# Altium schematic sheet 03_ADC_Reference.SchDoc
size A; SheetNumber: 2; SheetTotal: 6
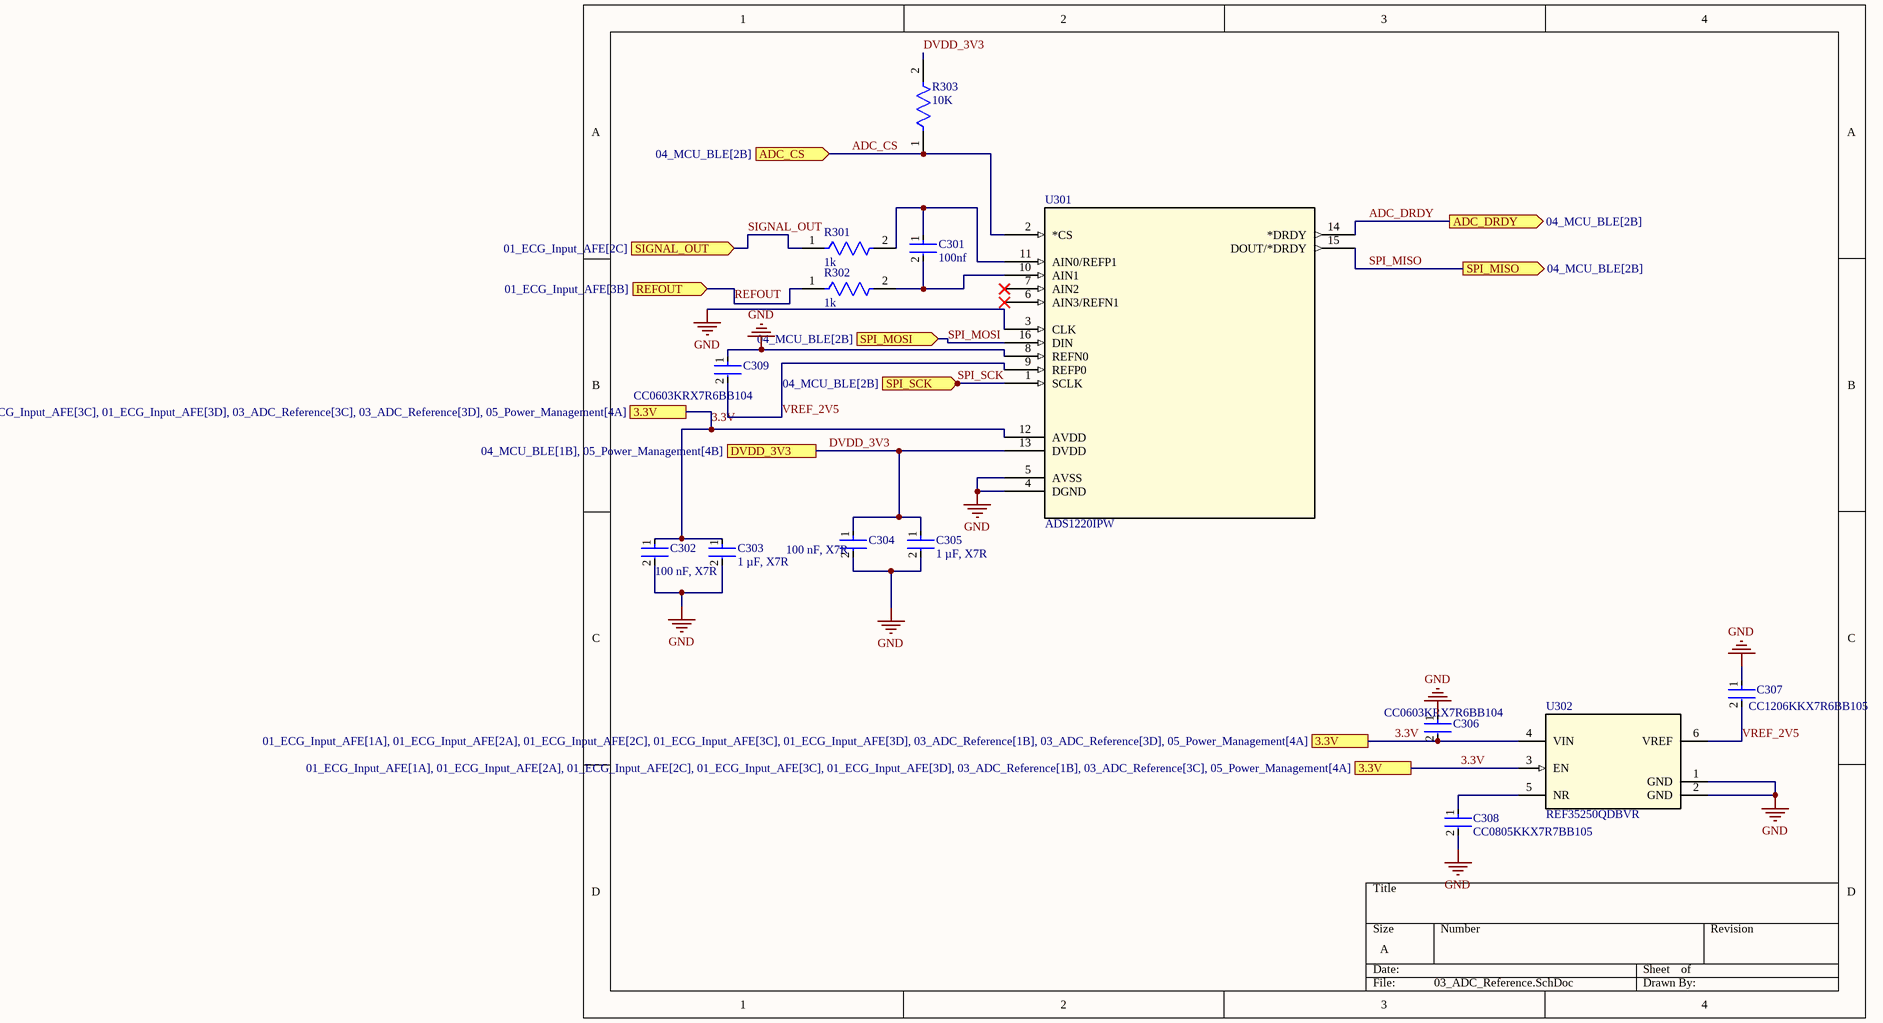
[diagram p0: 03_ADC_Reference.SchDoc]

## Parts
C301  100nf  [FP-CC0603-DA-MFG]
C302  100 nF, X7R  [FP-CC0603-DA-MFG]
C303  1 µF, X7R  [FP-CC0805-0_85-MFG]
C304  100 nF, X7R  [FP-CC0603-DA-MFG]
C305  1 µF, X7R  [FP-CC0805-0_85-MFG]
C306  CC0603KRX7R6BB104  [FP-CC0603-DA-MFG]
C307  CC1206KKX7R6BB105  [FP-CC1206-1_25-MFG]
C308  CC0805KKX7R7BB105  [FP-CC0805-0_85-MFG]
C309  CC0603KRX7R6BB104  [FP-CC0603-DA-MFG]
R301  1k  [FP-AC0603-IPC_B]
R302  1k  [FP-AC0603-IPC_B]
R303  10K  [FP-MCT0603-IPC_B]
U301  ADS1220IPW  [PW16]
U302  REF35250QDBVR  [DBV0006A-IPC_A]

## Ports
3.3V (see 01_ECG_Input_AFE[1A], 01_ECG_Input_AFE[2A], 01_ECG_Input_AFE[2C], 01_ECG_Input_AFE[3C], 01_ECG_Input_AFE[3D], 03_ADC_Reference[1B], 03_ADC_Reference[3C], 05_Power_Management[4A]), 3.3V (see 01_ECG_Input_AFE[1A], 01_ECG_Input_AFE[2A], 01_ECG_Input_AFE[2C], 01_ECG_Input_AFE[3C], 01_ECG_Input_AFE[3D], 03_ADC_Reference[1B], 03_ADC_Reference[3D], 05_Power_Management[4A]), 3.3V (see 01_ECG_Input_AFE[1A], 01_ECG_Input_AFE[2A], 01_ECG_Input_AFE[2C], 01_ECG_Input_AFE[3C], 01_ECG_Input_AFE[3D], 03_ADC_Reference[3C], 03_ADC_Reference[3D], 05_Power_Management[4A]), ADC_CS (in, see 04_MCU_BLE[2B]), ADC_DRDY (out, see 04_MCU_BLE[2B]), DVDD_3V3 (see 04_MCU_BLE[1B], 05_Power_Management[4B]), REFOUT (in, see 01_ECG_Input_AFE[3B]), SIGNAL_OUT (in, see 01_ECG_Input_AFE[2C]), SPI_MISO (out, see 04_MCU_BLE[2B]), SPI_MOSI (in, see 04_MCU_BLE[2B]), SPI_SCK (in, see 04_MCU_BLE[2B])

## Nets
GND: C302.2 C303.2 C304.2 C305.2 C306.1 C307.1 C308.2 C309.1 U301.3(CLK) U301.4(DGND) U301.5(AVSS) U301.8(REFN0) U302.1(GND) U302.2(GND)
3.3V: C302.1 C303.1 C306.2 U301.12(AVDD) U302.3(EN) U302.4(VIN) ; port 3.3V
ADC_CS: R303.1 U301.2(*CS) ; port ADC_CS
ADC_DRDY: U301.14(*DRDY) ; port ADC_DRDY
DVDD_3V3: C304.1 C305.1 R303.2 U301.13(DVDD) ; port DVDD_3V3
REFOUT: R302.1 ; port REFOUT
SIGNAL_OUT: R301.1 ; port SIGNAL_OUT
SPI_MISO: U301.15(DOUT/*DRDY) ; port SPI_MISO
SPI_MOSI: U301.16(DIN) ; port SPI_MOSI
SPI_SCK: U301.1(SCLK) ; port SPI_SCK
VREF_2V5: C307.2 C309.2 U301.9(REFP0) U302.6(VREF)
NetC301_1: C301.1 R301.2 U301.11(AIN0/REFP1)
NetC301_2: C301.2 R302.2 U301.10(AIN1)
NetC308_1: C308.1 U302.5(NR)

Not connected (* = marked no-connect by the designer): U301 6(AIN3/REFN1)* 7(AIN2)*

## Library data of the parts
C301 = CMP-03422-001228-1: CAP CER 0.1UF 10V X7R 0603, CC0603KRX7R6BB104; Manufacturer: YAGEO; Material: Ceramic; Tolerance: 0.1; Temperature Coefficient: 15%; Height: 0.9mm; RoHS: TRUE; Footprint Url: http://www.yageo.com/exep/pages/download/literatures/UPY-C_GEN_24.pdf; Octopart: https://octopart.com/cc0603krx7r6bb104-yageo-9291607; Device Class L1: Passive Components; Mouser Description: 0603 0.1 uF 10 V ±10 % Tolerance X7R SMT Multilayer Ceramic Capacitor; ComponentLink2URL: http://www.yageo.com/documents/recent/UPY-GPHC_X7R_6.3V-to-50V_18.pdf; Automotive: No; Voltage: 10 V; Capacitance: 100 nF; Device Class L3: Ceramic Capacitors; Category: Cap; Manufacturer Part Number: CC0603KRX7R6BB104; Temperature: -55°C to +125°C; ComponentLink2Description: Datasheet; Voltage Rating: 10 V; Device Class L2: Capacitors; Lead Free: Yes; Temperature Range High: +125°C; Temperature Range Low: -55°C; Digikey Description: CAP CER 0.1UF 10V X7R 0603; Package: CC0603-DA; Temperature Characteristic: X7R; Value: 100 nF
C302 = CMP-03422-001228-1: CAP CER 0.1UF 10V X7R 0603    CC0603KRX7R6BB104; Manufacturer: YAGEO; Material: Ceramic; Tolerance: 0.1; Capacitance: 100 nF; Temperature Coefficient: 15%; Value: 100 nF; Height: 0.9mm; RoHS: TRUE; Footprint Url: http://www.yageo.com/exep/pages/download/literatures/UPY-C_GEN_24.pdf; Octopart: https://octopart.com/cc0603krx7r6bb104-yageo-9291607; Device Class L1: Passive Components; Mouser Description: 0603 0.1 uF 10 V ±10 % Tolerance X7R SMT Multilayer Ceramic Capacitor; ComponentLink2URL: http://www.yageo.com/documents/recent/UPY-GPHC_X7R_6.3V-to-50V_18.pdf; Automotive: No; Voltage: 10 V; Device Class L3: Ceramic Capacitors; Category: Cap; Manufacturer Part Number: CC0603KRX7R6BB104; Temperature: -55°C to +125°C; ComponentLink2Description: Datasheet; Voltage Rating: 10 V; Device Class L2: Capacitors; Lead Free: Yes; Temperature Range High: +125°C; Temperature Range Low: -55°C; Digikey Description: CAP CER 0.1UF 10V X7R 0603; Package: CC0603-DA; Temperature Characteristic: X7R
C303 C305 = CMP-03422-000373-1: CC0805 1 uF X7R 10.00% 25 V, CC0805KFX7R8BB105; Manufacturer: Yageo; Voltage Rating: 25 V; Value: 1 uF; Tolerance: 0.1; Material: Ceramic; Category: Cap; Footprint Url: http://www.yageo.com/exep/pages/download/literatures/UPY-C_GEN_24.pdf; ComponentLink2Description: Datasheet; Temperature Characteristic: X7R; Temperature Range High: +85°C; Manufacturer Part Number: CC0805KFX7R8BB105; Mouser Description: CC Series 0805 1 uF 25 V ±10% Tolerance X7R Multilayer Ceramic Capacitor; Package: CC0805-0.85; Device Class L1: Passive Components; Automotive: No; RoHS: TRUE; Octopart: https://octopart.com/cc0805kfx7r8bb105-yageo-33242303; Capacitance: 1 uF; Device Class L2: Capacitors; Ipc Land Pattern Name: CAPC200125X85; Temperature Range Low: -30°C; Temperature: -30°C to +85°C; Height: 0.95mm; ComponentLink2URL: http://www.yageo.com/documents/recent/UPY-GPHC_Y5V_6.3V-to-50V_8.pdf; Device Class L3: Ceramic Capacitors; Lead Free: Yes
C304 = CMP-03422-001228-1: CAP CER 0.1UF 10V X7R 0603, CC0603KRX7R6BB104; Manufacturer: YAGEO; Material: Ceramic; Tolerance: 0.1; Capacitance: 100 nF; Temperature Coefficient: 15%; Value: 100 nF; Height: 0.9mm; RoHS: TRUE; Footprint Url: http://www.yageo.com/exep/pages/download/literatures/UPY-C_GEN_24.pdf; Octopart: https://octopart.com/cc0603krx7r6bb104-yageo-9291607; Device Class L1: Passive Components; Mouser Description: 0603 0.1 uF 10 V ±10 % Tolerance X7R SMT Multilayer Ceramic Capacitor; ComponentLink2URL: http://www.yageo.com/documents/recent/UPY-GPHC_X7R_6.3V-to-50V_18.pdf; Automotive: No; Voltage: 10 V; Device Class L3: Ceramic Capacitors; Category: Cap; Manufacturer Part Number: CC0603KRX7R6BB104; Temperature: -55°C to +125°C; ComponentLink2Description: Datasheet; Voltage Rating: 10 V; Device Class L2: Capacitors; Lead Free: Yes; Temperature Range High: +125°C; Temperature Range Low: -55°C; Digikey Description: CAP CER 0.1UF 10V X7R 0603; Package: CC0603-DA; Temperature Characteristic: X7R
C306 C309 = CMP-03422-001228-1: CAP CER 0.1UF 10V X7R 0603; Manufacturer: YAGEO; Material: Ceramic; Tolerance: 0.1; Capacitance: 100 nF; Temperature Coefficient: 15%; Value: 100 nF; Height: 0.9mm; RoHS: TRUE; Footprint Url: http://www.yageo.com/exep/pages/download/literatures/UPY-C_GEN_24.pdf; Octopart: https://octopart.com/cc0603krx7r6bb104-yageo-9291607; Device Class L1: Passive Components; Mouser Description: 0603 0.1 uF 10 V ±10 % Tolerance X7R SMT Multilayer Ceramic Capacitor; ComponentLink2URL: http://www.yageo.com/documents/recent/UPY-GPHC_X7R_6.3V-to-50V_18.pdf; Automotive: No; Voltage: 10 V; Device Class L3: Ceramic Capacitors; Category: Cap; Manufacturer Part Number: CC0603KRX7R6BB104; Temperature: -55°C to +125°C; ComponentLink2Description: Datasheet; Voltage Rating: 10 V; Device Class L2: Capacitors; Lead Free: Yes; Temperature Range High: +125°C; Temperature Range Low: -55°C; Digikey Description: CAP CER 0.1UF 10V X7R 0603; Package: CC0603-DA; Temperature Characteristic: X7R
C307 = CMP-03422-001171-1: CAP CER 1UF 10V X7R 1206; Manufacturer: Yageo; Material: Ceramic; Tolerance: 0.1; Automotive Grade: NA; Temperature Coefficient: 15%; Category: Cap; Package: CC1206-1.25; Device Class L3: Ceramic Capacitors; Footprint Url: http://www.yageo.com/exep/pages/download/literatures/UPY-C_GEN_24.pdf; Octopart: https://octopart.com/cc1206kkx7r6bb105-yageo-21769912; Temperature Range High: +125°C; Lead Free: Yes; Capacitance: 1 uF; Voltage Rating: 10 V; ComponentLink2Description: Datasheet; ComponentLink2URL: http://www.yageo.com/documents/recent/UPY-NP0X7R_HV_1KV-to-3KV_11.pdf; Height: 1.45mm; Device Class L1: Passive Components; Temperature Range Low: -55°C; Value: 1 uF; Device Class L2: Capacitors; Digikey Description: CAP CER 1UF 10V X7R 1206; RoHS: TRUE; Mouser Description: Multilayer Ceramic Capacitors MLCC - SMD/SMT 1.0uF 10V X7R 10%; Temperature Characteristic: X7R; Automotive: No; Temperature: -55°C to +125°C; Manufacturer Part Number: CC1206KKX7R6BB105
C308 = CMP-03422-000001-1: CAP CER 1UF 16V X7R 0805; Manufacturer: Yageo; Material: Ceramic; Tolerance: 0.1; Voltage Rating: 16 V; Category: Cap; Capacitance: 1 uF; ComponentLink2Description: Datasheet; Automotive: No; Temperature Range High: +85°C; RoHS: TRUE; Footprint Url: http://www.yageo.com/exep/pages/download/literatures/UPY-C_GEN_24.pdf; Mouser Description: Multilayer Ceramic Capacitors MLCC - SMD/SMT 1.0uF 16V X7R 10%; Height: 0.95mm; Ipc Land Pattern Name: CAPC200125X85; Temperature: -30°C to +85°C; Lead Free: Yes; Value: 1 uF; Temperature Characteristic: X7R; Package: CC0805-0.85; Temperature Range Low: -30°C; Device Class L1: Passive Components; Device Class L3: Ceramic Capacitors; Octopart: https://octopart.com/cc0805kkx7r7bb105-yageo-8376555; Manufacturer Part Number: CC0805KKX7R7BB105; ComponentLink2URL: http://www.yageo.com/documents/recent/UPY-GPHC_Y5V_6.3V-to-50V_8.pdf; Device Class L2: Capacitors; Digikey Description: CAP CER 1UF 16V X7R 0805
R301 R302 = CMP-03412-047577-1: RES 1kΩ 1.00% 0.2W 0603, AC0603FR-7W1KL
R303 = CMP-02407-001090-1: RES SMD 10K OHM 1% 1/8W 0603, MCT0603HC1002FP500
U301 = ADS1220IPW: 24-bit, 2-kSPS, four-channel, low-power, delta-sigma ADC with PGA, VREF, SPI and two IDACs 16-TSSOP -40 to 125; Manufacturer_Name: Texas Instruments; Copyright: Copyright (C) 2026 Ultra Librarian. All rights reserved.; Manufacturer_Part_Number: ADS1220IPW; Datasheet: https://www.ti.com/lit/gpn/ads1220; RefDes: RefDes; Type: Type
U302 = REF35250QDBVR: 650-nA quiescent current, 12-ppm/Â°C drift, ultra-low-power precision voltage reference 6-SOT-23 -40 to 125; Manufacturer_Name: Texas Instruments; TYPE: TYPE; RefDes: RefDes; Copyright: Copyright (C) 2026 Ultra Librarian. All rights reserved.; Manufacturer_Part_Number: REF35250QDBVR; Datasheet: https://www.ti.com/lit/gpn/ref35